# Altium schematic sheet HMS.LC76G.SchDoc
size A4
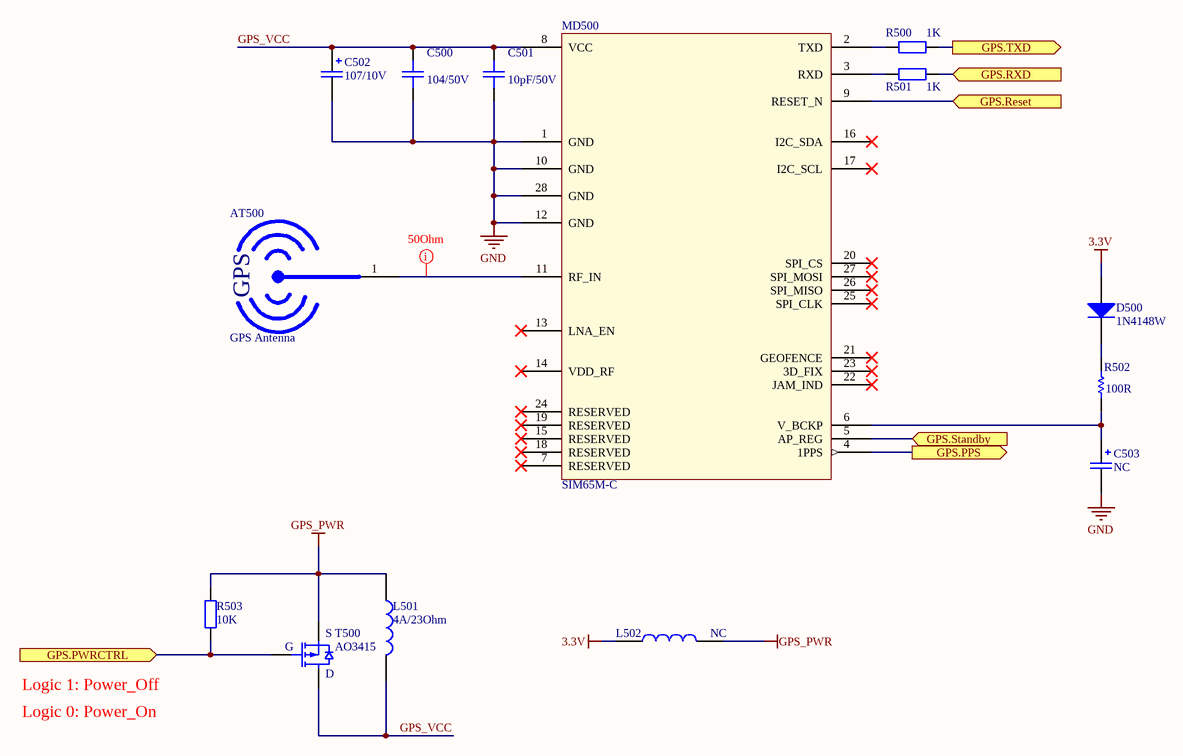
[diagram p0: HMS.LC76G.SchDoc]

## Parts
AT500  GPS Antenna  [ANT GPS Passive]
C500  104/50V  [CAP_CERAMIC_0402(1005)]
C501  10pF/50V  [CAP_CERAMIC_0402(1005)]
C502  107/10V  [CAP_TANTAL_1206(3216-18)]
C503  NC  [SPCAP0.22F]
D500  1N4148W  [DIODE_F03_1005]
L501  4A/23Ohm  [Inductor_0603]
L502  NC  [Inductor_0603]
MD500  SIM65M-C  [LC76G_GPS]
R500  1K  [RES_0402(1005)]
R501  1K  [RES_0402(1005)]
R502  100R  [RES_0402(1005)]
R503  10K  [RES_0402(1005)]
T500  AO3415  [SOT23-3]

## Ports
GPS.PPS (out), GPS.PWRCTRL (in), GPS.Reset (in), GPS.RXD (in), GPS.Standby (in), GPS.TXD (out)

## Nets
3.3V: D500.1(A) L502.1
GND: C500.1 C501.1 C502.2 C503.2 MD500.1(GND) MD500.10(GND) MD500.12(GND) MD500.28(GND)
GPS_PWR: L501.1 L502.2 R503.2 T500.2(S)
GPS.PPS: MD500.4(1PPS) ; port GPS.PPS
GPS.PWRCTRL: R503.1 T500.1(G) ; port GPS.PWRCTRL
GPS.Reset: MD500.9(RESET_N) ; port GPS.Reset
GPS.RXD: R501.2 ; port GPS.RXD
GPS.Standby: MD500.5(AP_REG) ; port GPS.Standby
GPS.TXD: R500.2 ; port GPS.TXD
GPS_VCC: C500.2 C501.2 C502.1 L501.2 MD500.8(VCC) T500.3(D)
NetAT500_1: AT500.1 MD500.11(RF_IN)
NetC503_1: C503.1 MD500.6(V_BCKP) R502.1
NetD500_2: D500.2(K) R502.2
NetMD500_2: MD500.2(TXD) R500.1
NetMD500_3: MD500.3(RXD) R501.1

Not connected (* = marked no-connect by the designer): MD500 7(RESERVED)* 13(LNA_EN)* 14(VDD_RF)* 15(RESERVED)* 16(I2C_SDA)* 17(I2C_SCL)* 18(RESERVED)* 19(RESERVED)* 20(SPI_CS)* 21(GEOFENCE)* 22(JAM_IND)* 23(3D_FIX)* 24(RESERVED)* 25(SPI_CLK)* 26(SPI_MISO)* 27(SPI_MOSI)*

## Layout directives
net class 50Ohm: NetAT500_1

## Notes on the sheet
- Logic 1: Power_Off
- Logic 0: Power_On
- (in symbol Antenna GPS Passive) GPS

## Library data of the parts
AT500 = Antenna GPS Passive: SWG018-35, Passive antenna 25x25x4mm, pin length 3.5mm, Three-proof varnish; MPN: SW25073IB93; Value: GPS Antenna
C500 C501 = Cap Cer 0603 (1608): CAP CER 0.1UF 50V X5R 0402; MPN: CC0402KRX5R9BB104; MFR: YAGEO; Published: 8-Jun-2000; LatestRevisionDate: 17-Jul-2002; LatestRevisionNote: Re-released for DXP Platform.; PackageReference: RAD-0.3; Publisher: Altium Limited; Category: Ceramic Capacitors
  C500: Value: 104/50V
  C501: Value: 10pF/50V
C502 = Cap Tantal 2312 (6032-28): Cap Tantal 10uF/6.3V 10% 1206; MPN: 293D106X96R3A2TE3; Value: 107/10V
C503 = DCK-3R3E224U-E: MFR: Elna America; Capacitance: 220mF; Voltage - Rated: 3.3V; Tolerance: -20%, +80%; ESR (Equivalent Series Resistance): 200 Ohm; Lifetime @ Temp.: 1000 Hrs @ 60°C; Published: 24-Mar-1999; LatestRevisionDate: 17-Jul-2002; LatestRevisionNote: Re-released for DXP Platform.; PackageReference: BAT-2; Publisher: Altium Limited; PackageDescription: Battery; 2 Leads; Supplier 1: Digi-Key; MPN: NC; RoHS: RoHS Compliant; Category: Capacitors; Stock 1: 7810; Pricing 1: 1=1.41, 10=1.114, 25=1.0208, 50=0.9652, 100=0.8352, 250=0.7424, 500=0.63104, 1000=0.5568, 2500=0.51968 (USD); Packaging: Bulk; Mounting Type: Surface Mount; Package / Case: Coin, Wide Terminals - Opposite Sides; Lead Spacing: 0.079" (2.00mm); Size / Dimension: 0.268" Dia (6.80mm); Height - Seated (Max): 0.083" (2.10mm); Operating Temperature: -10°C ~ 60°C; ComponentLink1URL: http://media.digikey.com/pdf/Data%20Sheets/Elna%20America%20Inc/DC_DCKe.pdf; ComponentLink1Description: http://media.digikey.com/pdf/Data%20Sheets/Elna%20America%20Inc/DC_DCKe.pdf; Supplier Part Number 1: 604-1007-ND; Value: NC
D500 = Diode F03: 1N4148 T4 SOD-123/1206 1N4148W; MFR: LinhKienChatLuong; Value: 1N4148W; Category: Diode; MPN: 1N4148W
L501 = FBMJ1608HM230NT: Inductor Ferrites 4A SMD 0603; MPN: NC; MFR: Taiyo Yuden; Category: Ferrite Beads and Chips; Value: 4A/23Ohm
L502 = CBC2012T470M: 47nH; Manufacturer: Taiyo Yuden; Inductance: 200nH; Current Rating: 150mA; Current - Saturation: 120mA; Tolerance: ±20%; Shielding: Unshielded; DC Resistance (DCR): 7.54 Ohm Max; Frequency - Self Resonant: 11MHz; Frequency - Test: 2.52MHz; Supplier 1: Digi-Key; Manufacturer Part Number: CBC2012T470M; RoHS: RoHS Compliant; Category: Inductors, Coils, Chokes; Stock 1: 108934; Pricing 1: 1=0.2, 10=0.188, 50=0.1762, 100=0.1645, 500=0.12926, 1000=0.10575 (USD); Packaging: Cut Tape (CT); Type: -; Material - Core: -; Q @ Freq: -; Operating Temperature: -40°C ~ 105°C; Package / Case: 0805 (2012 Metric); Size / Dimension: 0.079" L x 0.049" W x 0.049" H (2.00mm x 1.25mm x 1.25mm); Mounting Type: Surface Mount; ComponentLink1URL: http://www.yuden.co.jp/ut/product/category/inductor/CBC2012T470M.pdf; ComponentLink1Description: http://www.yuden.co.jp/ut/product/category/inductor/CBC2012T470M.pdf; Supplier Part Number 1: 587-1605-1-ND; Value: NC; MPN: NC
MD500 = LC76G: Compact GNSS Module; MPN: SIM65M-C; Value: SIM65M-C
R500 = RC0402FR-071KL: RES 1K OHM 1% 1/8W 0402; MFR: YAGEO; Voltage Rating: 50V; Power Rating: 1/16W; Value: 1K; MPN: RC0402FR-071KL; Category: 0402; Tolerance: 1%
R501 = RC0402FR-071KL: RES 1K OHM 1% 1/8W 0402; MPN: RC0402FR-131KL; MFR: YAGEO; Voltage Rating: 50V; Power Rating: 1/16W; Value: 1K; Category: 0402; Tolerance: 1%
R502 = Res1: RES 100 OHM 1% 1/8W 0402; MPN: RC0402FR-7W100RL; MFR: Vishay Dale; Published: 8-Jun-2000; LatestRevisionDate: 17-Jul-2002; LatestRevisionNote: Re-released for DXP Platform.; PackageReference: AXIAL-0.3; Publisher: Altium Limited; Value: 100R; Category: Chip Resistor - Surface Mount
R503 = RC0402JR-0710KL: RES 10K OHM 5% 1/8W 0402; MFR: YAGEO; MPN: RC0402JR-0710KL; Category: Chip Resistor - Surface Mount; Value: 10K
T500 = A03415: Mosfet P Channel; MPN: AO3415; Category: Transistor PNP; Value: AO3415